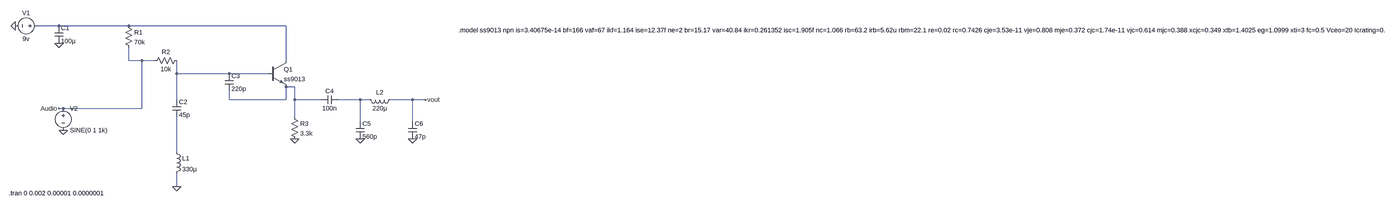
[diagram p0: schematic transient_with_both_signals.asc, whole sheet]
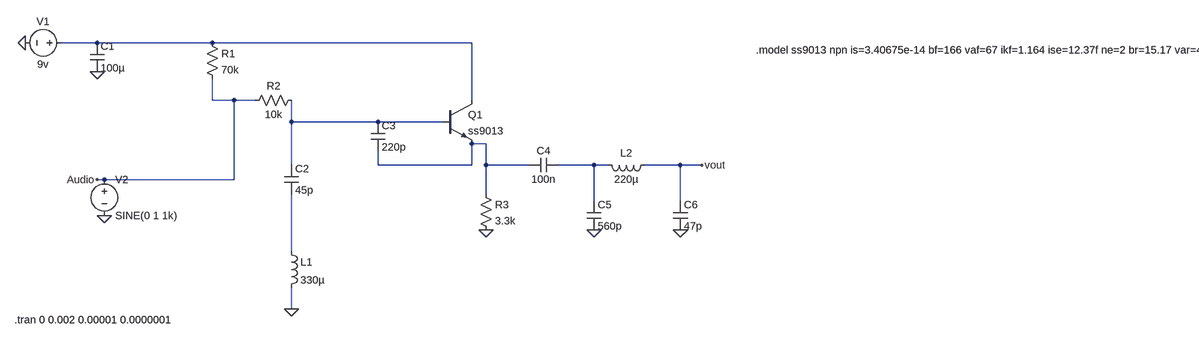
[diagram p1: schematic transient_with_both_signals.asc, part, row 1 of 1, column 1 of 2]
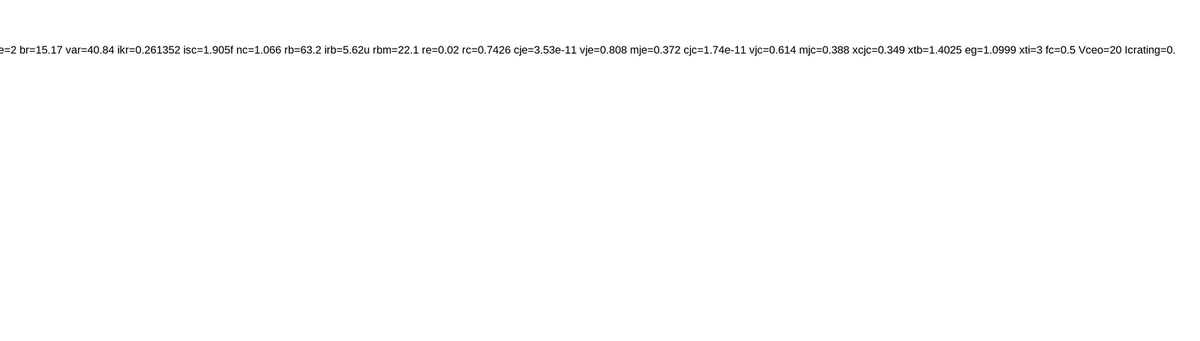
[diagram p2: schematic transient_with_both_signals.asc, part, row 1 of 1, column 2 of 2]
transient_with_both_signals.asc, the LTspice schematic file:
Version 4
SHEET 1 5608 680
WIRE 32 32 -48 32
WIRE 288 32 32 32
WIRE 976 32 288 32
WIRE 288 160 288 112
WIRE 336 160 288 160
WIRE 384 160 336 160
WIRE 976 160 976 32
WIRE 464 208 464 160
WIRE 768 208 464 208
WIRE 912 208 768 208
WIRE 1008 256 976 256
WIRE 464 304 464 208
WIRE 768 304 768 272
WIRE 976 304 976 256
WIRE 976 304 768 304
WIRE 1008 304 1008 256
WIRE 1104 304 1008 304
WIRE 1248 304 1168 304
WIRE 1280 304 1248 304
WIRE 1440 304 1360 304
WIRE 1488 304 1440 304
WIRE 48 336 32 336
WIRE 336 336 336 160
WIRE 336 336 48 336
WIRE 1008 368 1008 304
WIRE 1248 384 1248 304
WIRE 1440 384 1440 304
WIRE 464 496 464 368
WIRE 464 624 464 576
FLAG -128 32 0
FLAG 32 96 0
FLAG 464 624 0
FLAG 1008 448 0
FLAG 1248 448 0
FLAG 1440 448 0
FLAG 1488 304 vout
FLAG 32 336 Audio
FLAG 48 416 0
SYMBOL voltage -32 32 R90
WINDOW 0 -32 56 VBottom 2
WINDOW 3 32 56 VTop 2
SYMATTR InstName V1
SYMATTR Value 9v
SYMBOL cap 16 32 R0
SYMATTR InstName C1
SYMATTR Value 100µ
SYMBOL res 272 16 R0
SYMATTR InstName R1
SYMATTR Value 70k
SYMBOL res 480 144 R90
WINDOW 0 0 56 VBottom 2
WINDOW 3 32 56 VTop 2
SYMATTR InstName R2
SYMATTR Value 10k
SYMBOL cap 448 304 R0
SYMATTR InstName C2
SYMATTR Value 45p
SYMBOL ind 448 480 R0
SYMATTR InstName L1
SYMATTR Value 330µ
SYMBOL cap 752 208 R0
SYMATTR InstName C3
SYMATTR Value 220p
SYMBOL cap 1168 288 R90
WINDOW 0 0 32 VBottom 2
WINDOW 3 32 32 VTop 2
SYMATTR InstName C4
SYMATTR Value 100n
SYMBOL res 992 352 R0
SYMATTR InstName R3
SYMATTR Value 3.3k
SYMBOL cap 1232 384 R0
SYMATTR InstName C5
SYMATTR Value 560p
SYMBOL ind 1376 288 R90
WINDOW 0 5 56 VBottom 2
WINDOW 3 32 56 VTop 2
SYMATTR InstName L2
SYMATTR Value 220µ
SYMBOL cap 1424 384 R0
SYMATTR InstName C6
SYMATTR Value 47p
SYMBOL npn 912 160 R0
SYMATTR InstName Q1
SYMATTR Value ss9013
SYMBOL voltage 48 320 R0
WINDOW 123 0 0 Left 0
WINDOW 39 0 0 Left 0
SYMATTR InstName V2
SYMATTR Value SINE(0 1 1k)
TEXT -152 648 Left 2 !.tran 0 0.002 0.00001 0.0000001
TEXT 1608 48 Left 2 !.model ss9013 npn is=3.40675e-14 bf=166 vaf=67 ikf=1.164 ise=12.37f ne=2 br=15.17 var=40.84 ikr=0.261352 isc=1.905f nc=1.066 rb=63.2 irb=5.62u rbm=22.1 re=0.02 rc=0.7426 cje=3.53e-11 vje=0.808 mje=0.372 cjc=1.74e-11 vjc=0.614 mjc=0.388 xcjc=0.349 xtb=1.4025 eg=1.0999 xti=3 fc=0.5 Vceo=20 Icrating=0.5 mfg=Fairchild

The netlist it stands for:
* transient_with_both_signals.asc
V1 N001 0 9v
C1 N001 0 100µ
R1 N001 Audio 70k
R2 N002 Audio 10k
C2 N002 N005 45p
L1 N005 0 330µ
C3 N002 N003 220p
C4 N004 N003 100n
R3 N003 0 3.3k
C5 N004 0 560p
L2 vout N004 220µ
C6 vout 0 47p
Q1 N001 N002 N003 0 ss9013
V2 Audio 0 SINE(0 1 1k)
.model NPN NPN
.model PNP PNP
.lib standard.bjt
.tran 0 0.002 0.00001 0.0000001
.model ss9013 npn is=3.40675e-14 bf=166 vaf=67 ikf=1.164 ise=12.37f ne=2 br=15.17 var=40.84 ikr=0.261352 isc=1.905f nc=1.066 rb=63.2 irb=5.62u rbm=22.1 re=0.02 rc=0.7426 cje=3.53e-11 vje=0.808 mje=0.372 cjc=1.74e-11 vjc=0.614 mjc=0.388 xcjc=0.349 xtb=1.4025 eg=1.0999 xti=3 fc=0.5 Vceo=20 Icrating=0.5 mfg=Fairchild
.backanno
.end